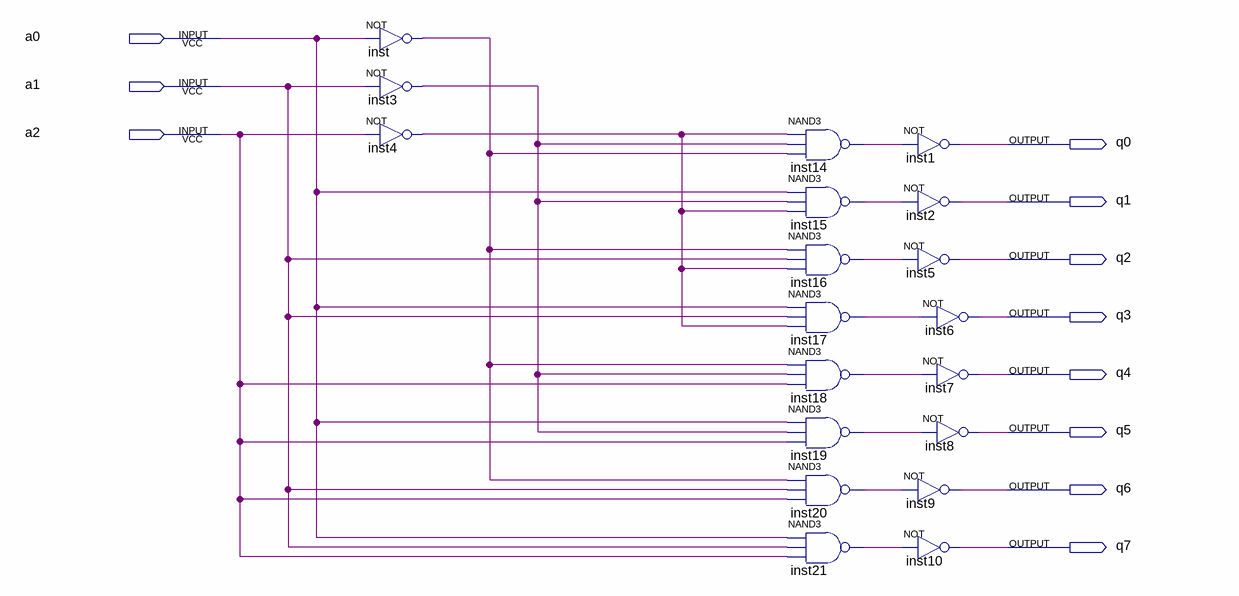
[diagram p0: schematic sheet]
// Quartus schematic decoder_3-8.bdf as structural Verilog: 19 symbols, 11 pins
module \decoder_3-8  (
  input  a0,
  input  a1,
  input  a2,
  output q0,
  output q1,
  output q2,
  output q3,
  output q4,
  output q5,
  output q6,
  output q7
);

  wire inst3_out, inst4_out, inst14_out, inst15_out, inst16_out, inst17_out, inst18_out, inst19_out,
       inst20_out, inst21_out, inst_out;

  not inst (inst_out, a0);
  not inst3 (inst3_out, a1);
  not inst4 (inst4_out, a2);
  nand inst14 (inst14_out, inst4_out, inst3_out, inst_out);
  nand inst15 (inst15_out, a0, inst3_out, inst4_out);
  nand inst16 (inst16_out, inst_out, a1, inst4_out);
  nand inst17 (inst17_out, a0, a1, inst4_out);
  nand inst18 (inst18_out, inst_out, inst3_out, a2);
  nand inst19 (inst19_out, a0, inst3_out, a2);
  nand inst20 (inst20_out, inst_out, a1, a2);
  nand inst21 (inst21_out, a0, a1, a2);
  not inst1 (q0, inst14_out);
  not inst2 (q1, inst15_out);
  not inst5 (q2, inst16_out);
  not inst6 (q3, inst17_out);
  not inst7 (q4, inst18_out);
  not inst8 (q5, inst19_out);
  not inst9 (q6, inst20_out);
  not inst10 (q7, inst21_out);
endmodule
